# EasyEDA Pro project ProProject_F4_2025-05-21.epro, board PCB1_2
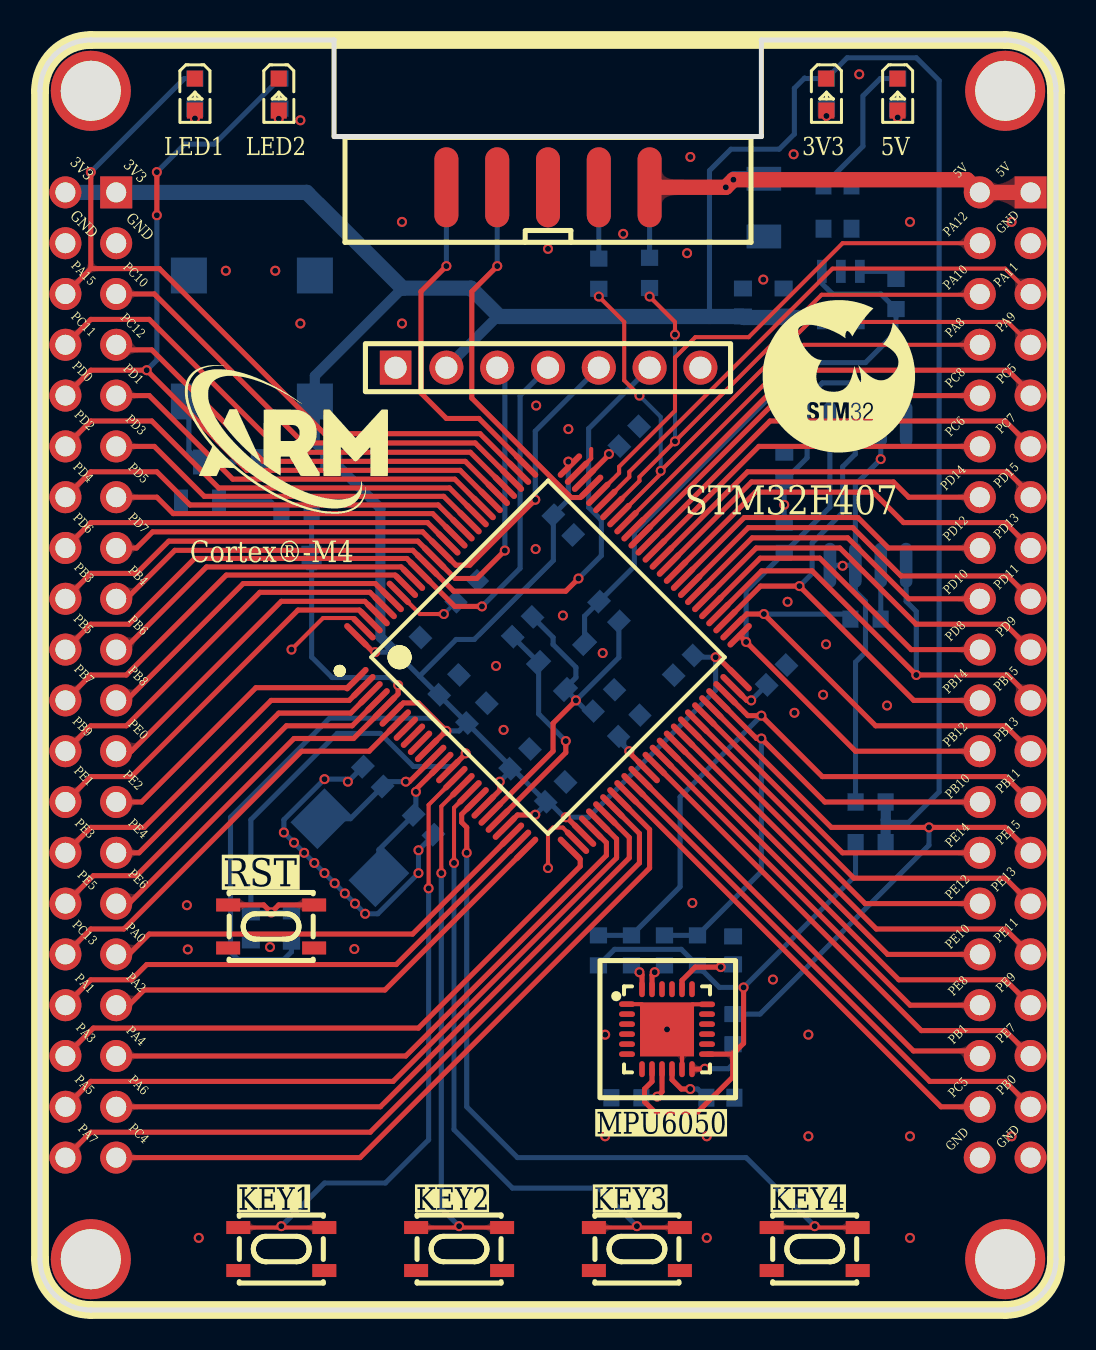
[diagram p8: board, top side]
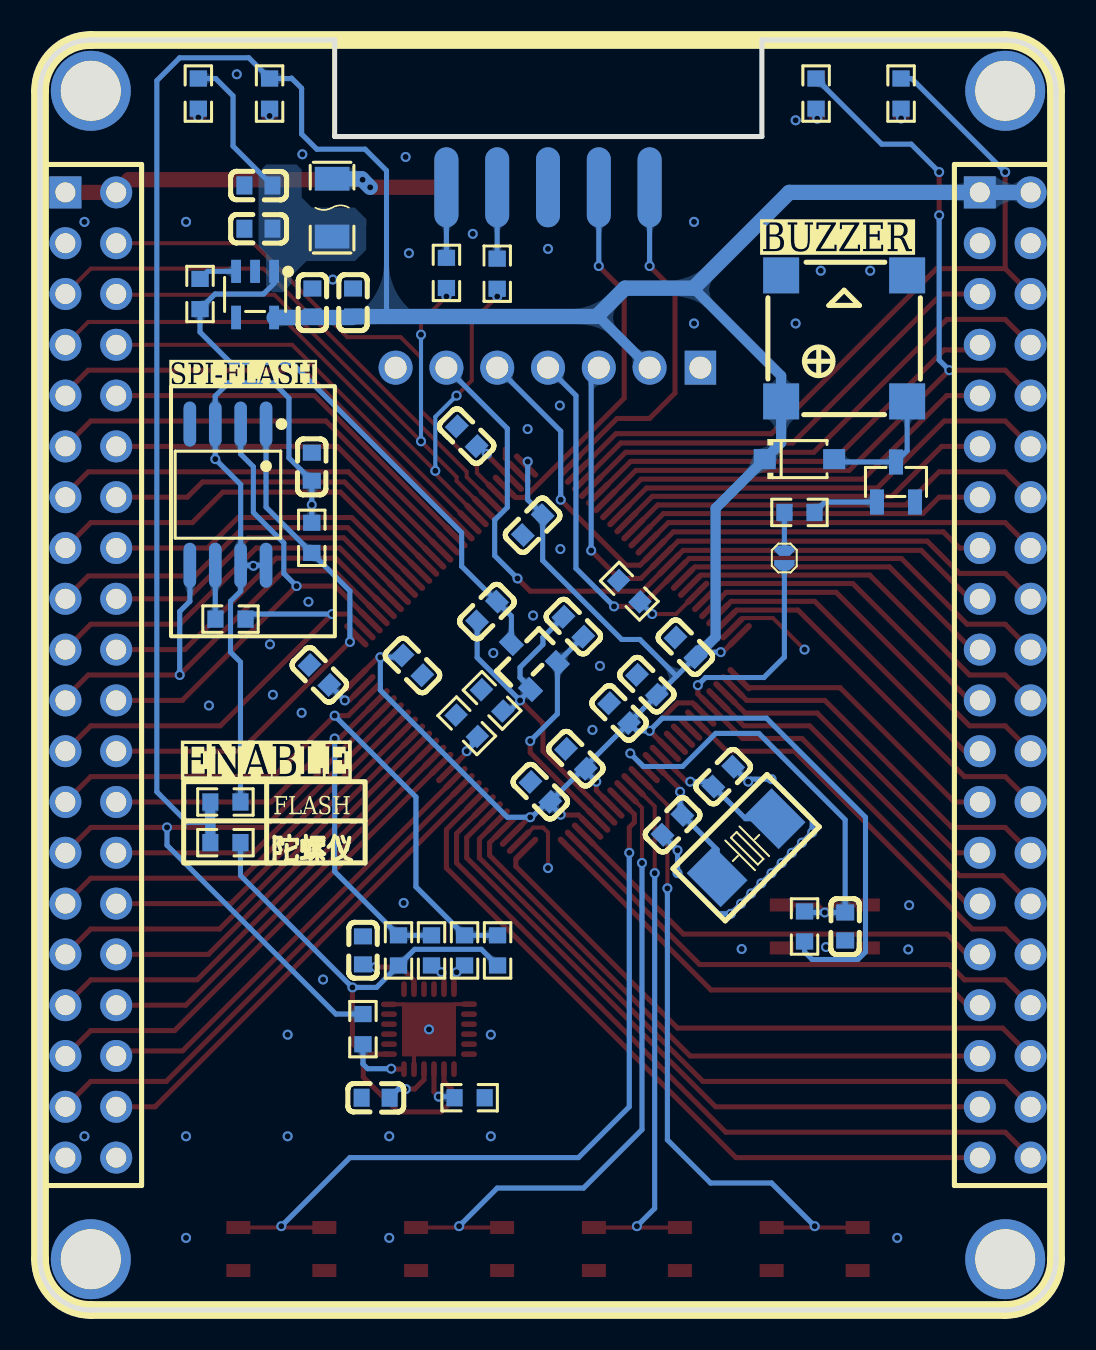
[diagram p9: board, bottom side, seen from below]

Outline 50.8 x 63.5 mm; copper layers: Top Layer, Bottom Layer. Coordinates in mm from the lower left corner of the outline.
Outline path: 0,60.96 0,2.54 arc(0.74,0.74) 2.54,0 48.26,0 arc(50.06,0.74) 50.8,2.54 50.8,60.96 arc(50.06,62.76) 48.26,63.5 36.07,63.5 36.07,58.67 14.7,58.67 14.7,63.5 2.54,63.5 arc(0.74,62.76) 0,60.96
Stack: Top Layer 0.035mm - / Dielectric1 1.51mm FR4 er 4.5 / Bottom Layer 0.035mm -

## Design rules (mm)
net OSC_OUT: DP4
net OSC_IN: DP4
net OSC32_IN: DP3
net OSC32_OUT: DP3
template: 自定义配置
spacing copperThickness1oz (default): track to track 0.102, other pairs 0.152 to 0.3
spacing copperThickness2oz: track to track 0.203, other pairs 0.152 to 0.3
track width copperThickness1oz (default): min 0.127, default 0.254, max 2.54
track width copperThickness2oz: min 0.203, default 0.254, max 2.54
differential pair differentialPair (default): width min 0.127, default 0.254, max 2.54; gap min 0.152, default 0.152
via viaSize (default): diameter min 0.399, default 0.5, max 10; hole min 0.3, default 0.3, max 6.299

## Placement (name value [footprint] x y rotation side)
BUZZER1  SMD-7525  [BUZ-SMD_4P-L7.5-W7.5-BR]  10.59 48.58 270 bottom
C17  100nF  [C0603]  37.21 42.16 90 bottom
C19  1uF  [C0603]  39.88 56.22 0 bottom
C20  10nF  [C0603]  39.88 54.06 0 bottom
C21  1uF  [C0603]  37.18 50.38 90 bottom
C22  10nF  [C0603]  35.15 50.38 90 bottom
D2  1N4148W  [SOD-123F_L2.7-W1.6-LS3.8-RD]  12.83 42.55 180 bottom
H1  -  [HDR-TH_7P-P2.54-V-F]  25.4 47.12 0 top
LED2  -  [LED_0603]  39.32 60.72 270 top
LED5  -  [LED_0603]  42.89 60.72 270 top
LED8  -  [LED_0603]  7.75 60.72 270 top
LED9  -  [LED_0603]  11.94 60.72 270 top
NOREF  -  [Pad_e925]  48.26 2.54 0 top
NOREF#2  -  [Pad_e924]  2.54 2.54 0 top
NOREF#3  -  [Pad_e923]  2.54 60.96 0 top
NOREF#4  -  [Pad_e112]  48.26 60.96 0 top
P1  2.54-2*5P简牛  [简牛2*5-2.54]  25.4 56.13 0 top
Q3  SS8050  [SOT-23-3_L2.9-W1.3-P1.90-LS2.4-BR]  8 41.4 270 bottom
R3  10kΩ  [R0603]  12.57 19.18 270 bottom
R4  20Ω  [R0603]  27.94 51.82 90 bottom
R5  20Ω  [R0603]  30.48 51.85 90 bottom
R8  180  [R0603]  12.83 39.88 180 bottom
R12  10K  [R0603]  42.8 50.8 270 bottom
R16  10K  [R0603]  21.34 35.94 45 bottom
R17  0  [R0603]  28.19 30.48 45 bottom
R22  10K  [R0603]  29.46 29.21 45 bottom
R27  10K  [R0603]  27.92 17.98 270 bottom
R28  10K  [R0603]  32.88 17.98 270 bottom
R29  120R  [R0603]  29.57 17.98 90 bottom
R30  120R  [R0603]  31.22 17.98 90 bottom
R31  120R  [R0603]  34.65 14.04 270 bottom
R32  10K  [R0603]  29.32 10.61 0 bottom
R44  22  [R0603]  41.28 34.54 0 bottom
R45  10K  [R0603]  37.21 38.61 90 bottom
R47  10kΩ  [R0603]  39.32 60.82 90 bottom
R50  10kΩ  [R0603]  42.88 60.82 90 bottom
R53  10kΩ  [R0603]  7.75 60.82 90 bottom
R54  10kΩ  [R0603]  12 60.82 90 bottom
R56  0  [R0603]  41.53 23.37 0 bottom
R57  0  [R0603]  41.53 25.4 0 bottom
RST  YTS-A016-2  [SW-SMD_4P-L4.2-W3.3-P2.15-LS4.7]  11.56 19.18 0 top
SW3  YTS-A016-2  [SW-SMD_4P-L4.2-W3.3-P2.15-LS4.7]  12.06 3.05 0 top
SW4  YTS-A016-2  [SW-SMD_4P-L4.2-W3.3-P2.15-LS4.7]  20.96 3.05 0 top
SW5  YTS-A016-2  [SW-SMD_4P-L4.2-W3.3-P2.15-LS4.7]  29.84 3.05 180 top
SW6  YTS-A016-2  [SW-SMD_4P-L4.2-W3.3-P2.15-LS4.7]  38.74 3.05 180 top
U1  STM32F407VET6  [LQFP-100_L14.0-W14.0-P0.50-LS16.0-BL]  25.4 32.64 315 top
U2  18pF  [C0603]  16.64 26.67 135 bottom
U3  18pF  [C0603]  19.18 24.26 315 bottom
U4  PJ75AL33SA  [SOT-23_L2.9-W1.3-P1.90-LS2.4-BR]  26.42 32.51 225 bottom
U5  100nF  [C0603]  24.13 34.16 225 bottom
U6  1uF  [C0603]  28.45 34.92 135 bottom
U7  1uF  [C0603]  36.83 31.75 225 bottom
U8  1uF  [C0603]  29.46 43.69 225 bottom
U9  100nF  [C0603]  10.54 19.18 90 bottom
U16  100nF  [C0603]  24 27.56 225 bottom
U17  100nF  [C0603]  21.84 29.84 225 bottom
U18  100nF  [C0603]  20.45 31.26 225 bottom
U19  100nF  [C0603]  18.53 33.13 225 bottom
U20  100nF  [C0603]  26.16 39.24 135 bottom
U29  100nF  [C0603]  25.78 25.91 225 bottom
U30  100nF  [C0603]  32.18 32.23 45 bottom
U31  1.5A快恢复保险丝-1206  [F1206]  36.19 55.12 270 bottom
U32  MPU-6050  [QFN-24_L4.0-W4.0-P0.50-BL-EP2.7]  31.35 14.04 270 top
U33  100nF  [C0603]  34.02 10.61 0 bottom
U34  100nF  [C0603]  34.65 17.98 270 bottom
U36  -  [短接焊盘]  13.59 37.59 90 bottom
U37  W25Q128JVSIQ  [SOIC-8_L5.3-W5.3-P1.27-LS8.0-BL]  41.4 40.77 0 bottom
U38  2.54-2*20  [HDR-TH_40P-P2.54-V-F-R2-C20-S2.54]  48.26 31.75 270 bottom
U39  2.54-2*20  [HDR-TH_40P-P2.54-V-F-R2-C20-S2.54]  2.54 31.75 270 bottom
U40  RT9013-33GB  [SOT-23-5_L3.0-W1.7-P0.95-LS2.8-BL]  40.05 50.78 0 bottom
X1  8MHz  [OSC-SMD_L5.0-W3.2]  15.49 23.11 135 bottom

## Footprints (pads in the part's own frame, mm; a bottom-side part is the same pattern mirrored in y, then rotated)
BUZ-SMD_4P-L7.5-W7.5-BR
  rect 1.8x1.8 smd: 1(3.15,-3.15) 2(3.15,3.15) 3(-3.15,3.15) 4(-3.15,-3.15)
C0603
  rect 0.8x0.9 smd: 1(-0.7,0) 2(0.7,0)
F1206
  rect 1.19x1.728 smd: 1(-1.445,0) 2(1.445,0)
HDR-TH_7P-P2.54-V-F
  rect 1.575x1.7 hole 1.1: 1(-7.62,0)
  round 1.7 hole 1.1: 2(-5.08,0) 3(-2.54,0) 4(0,0) 5(2.54,0) 6(5.08,0) 7(7.62,0)
HDR-TH_40P-P2.54-V-F-R2-C20-S2.54
  rect 1.6x1.6 hole 1: 1(-24.13,-1.27)
  round 1.6 hole 1: 2(-24.13,1.27) 3(-21.59,-1.27) 4(-21.59,1.27) 5(-19.05,-1.27) 6(-19.05,1.27) 7(-16.51,-1.27) 8(-16.51,1.27) 9(-13.97,-1.27) 10(-13.97,1.27) 11(-11.43,-1.27) 12(-11.43,1.27) 13(-8.89,-1.27) 14(-8.89,1.27) 15(-6.35,-1.27) 16(-6.35,1.27) 17(-3.81,-1.27) 18(-3.81,1.27) 19(-1.27,-1.27) 20(-1.27,1.27) 21(1.27,-1.27) 22(1.27,1.27) 23(3.81,-1.27) 24(3.81,1.27) 25(6.35,-1.27) 26(6.35,1.27) 27(8.89,-1.27) 28(8.89,1.27) 29(11.43,-1.27) 30(11.43,1.27) 31(13.97,-1.27) 32(13.97,1.27) 33(16.51,-1.27) 34(16.51,1.27) 35(19.05,-1.27) 36(19.05,1.27) 37(21.59,-1.27) 38(21.59,1.27) 39(24.13,-1.27) 40(24.13,1.27)
LED_0603
  rect 0.8x0.8 smd: 1(-0.851,-0.01) 2(0.75,-0.005)
LQFP-100_L14.0-W14.0-P0.50-LS16.0-BL
  oval 0.3x1.6 smd: 1(-6,-7.55) 2(-5.5,-7.55) 3(-5,-7.55) 4(-4.5,-7.55) 5(-4,-7.55) 6(-3.5,-7.55) 7(-3,-7.55) 8(-2.5,-7.55) 9(-2,-7.55) 10(-1.5,-7.55) 11(-1,-7.55) 12(-0.5,-7.55) 13(0,-7.55) 14(0.5,-7.55) 15(1,-7.55) 16(1.5,-7.55) 17(2,-7.55) 18(2.5,-7.55) 19(3,-7.55) 20(3.5,-7.55) 21(4,-7.55) 22(4.5,-7.55) 23(5,-7.55) 24(5.5,-7.55) 25(6,-7.55) 51(6,7.55) 52(5.5,7.55) 53(5,7.55) 54(4.5,7.55) 55(4,7.55) 56(3.5,7.55) 57(3,7.55) 58(2.5,7.55) 59(2,7.55) 60(1.5,7.55) 61(1,7.55) 62(0.5,7.55) 63(0,7.55) 64(-0.5,7.55) 65(-1,7.55) 66(-1.5,7.55) 67(-2,7.55) 68(-2.5,7.55) 69(-3,7.55) 70(-3.5,7.55) 71(-4,7.55) 72(-4.5,7.55) 73(-5,7.55) 74(-5.5,7.55) 75(-6,7.55)
  oval 1.6x0.3 smd: 26(7.55,-6) 27(7.55,-5.5) 28(7.55,-5) 29(7.55,-4.5) 30(7.55,-4) 31(7.55,-3.5) 32(7.55,-3) 33(7.55,-2.5) 34(7.55,-2) 35(7.55,-1.5) 36(7.55,-1) 37(7.55,-0.5) 38(7.55,0) 39(7.55,0.5) 40(7.55,1) 41(7.55,1.5) 42(7.55,2) 43(7.55,2.5) 44(7.55,3) 45(7.55,3.5) 46(7.55,4) 47(7.55,4.5) 48(7.55,5) 49(7.55,5.5) 50(7.55,6) 76(-7.55,6) 77(-7.55,5.5) 78(-7.55,5) 79(-7.55,4.5) 80(-7.55,4) 81(-7.55,3.5) 82(-7.55,3) 83(-7.55,2.5) 84(-7.55,2) 85(-7.55,1.5) 86(-7.55,1) 87(-7.55,0.5) 88(-7.55,0) 89(-7.55,-0.5) 90(-7.55,-1) 91(-7.55,-1.5) 92(-7.55,-2) 93(-7.55,-2.5) 94(-7.55,-3) 95(-7.55,-3.5) 96(-7.55,-4) 97(-7.55,-4.5) 98(-7.55,-5) 99(-7.55,-5.5) 100(-7.55,-6)
OSC-SMD_L5.0-W3.2
  rect 1.9x2.4 smd: 1(-2.05,0) 2(2.05,0)
Pad_e112
  round 4 hole 3: 0(0,0)
Pad_e923
  round 4 hole 3: 0(0,0)
Pad_e924
  round 4 hole 3: 0(0,0)
Pad_e925
  round 4 hole 3: 0(0,0)
QFN-24_L4.0-W4.0-P0.50-BL-EP2.7
  oval 0.28x0.8 smd: 1(-1.25,-2) 2(-0.75,-2) 3(-0.25,-2) 4(0.25,-2) 5(0.75,-2) 6(1.25,-2) 13(1.25,2) 14(0.75,2) 15(0.25,2) 16(-0.25,2) 17(-0.75,2) 18(-1.242,2)
  oval 0.8x0.28 smd: 7(2,-1.25) 8(2,-0.75) 9(2,-0.25) 10(2,0.25) 11(2,0.75) 12(2,1.25) 19(-2,1.25) 20(-2,0.75) 21(-2,0.25) 22(-2,-0.25) 23(-2,-0.75) 24(-2,-1.25)
  rect 2.7x2.7 smd: 25(0.013,0)
R0603
  rect 0.806x0.864 smd: 1(-0.753,0) 2(0.753,0)
SOD-123F_L2.7-W1.6-LS3.8-RD
  rect 1.1x1 smd: 1(-1.735,0) 2(1.735,0)
SOIC-8_L5.3-W5.3-P1.27-LS8.0-BL
  oval 0.63x2.25 smd: 1(-1.905,-3.53) 2(-0.635,-3.53) 3(0.635,-3.53) 4(1.905,-3.53) 5(1.905,3.53) 6(0.635,3.53) 7(-0.635,3.53) 8(-1.905,3.53)
SOT-23-3_L2.9-W1.3-P1.90-LS2.4-BR
  rect 1.25x0.7 smd: 1(1,-0.95) 2(1,0.95) 3(-1,0)
SOT-23-5_L3.0-W1.7-P0.95-LS2.8-BL
  rect 0.49x1.157 smd: 1(-0.95,-1.153) 2(0,-1.153) 3(0.95,-1.153)
  rect 0.49x1.175 smd: 4(0.95,1.153) 5(-0.95,1.153)
SOT-23_L2.9-W1.3-P1.90-LS2.4-BR
  rect 1x0.8 smd: 1(1.15,-0.95) 2(1.15,0.95) 3(-1.15,0)
SW-SMD_4P-L4.2-W3.3-P2.15-LS4.7
  rect 1.2x0.65 smd: 1(-2.15,1.075) 2(2.15,1.075) 3(-2.15,-1.075) 4(2.15,-1.075)
短接焊盘
  custom 0.508x1.016 smd: 1(-0.353,-0.008) 2(0.368,-0.015)
简牛2*5-2.54
  oval 1.2x4 smd: 1(-5.08,0) 3(-2.54,0) 5(0,0) 7(2.54,0) 9(5.08,0)
  oval 1.2x4 smd far side: 2(-5.08,0) 4(-2.54,0) 6(0,0) 8(2.54,0) 10(5.08,0)

## Nets
As in the schematic.

Pads without a net: BUZZER1 3 4; H1 7; NOREF 0; NOREF#2 0; NOREF#3 0; NOREF#4 0; P1 1 3 7; U32 2 3 4 5 6 7 14 15 16 17 19 21 22; U40 4

## Via types
v1: diameter 0.503, hole 0.299, Top Layer to Bottom Layer, 19 vias
v2: diameter 0.5, hole 0.3, Top Layer to Bottom Layer, 105 vias

## Routing (per net, layer and track width the routed paths; a pad name or vN(x,y) marks a point on that pad's centre or on a via; arc(x,y) is an arc through that point)
3V3: length 209.6
  Top Layer w0.254: U1.19 22.99,25.98 v2(22.99,26.42) ; 15.82,33.73 16.66,32.89 v2(16.76,32.89) ; U1.11 20.3,28.96 v2(20.32,28.96) 18.92,30.35 18.16,30.35 U1.6 ; v2(33.78,32.64) 33.89,32.64 34.98,31.54 ; U1.22 23.88,24.75 24.75,24.75 v2(24.77,24.77) ; U1.28 26.33,24.64 v2(26.29,24.64)
  Bottom Layer w0.254: 18.03,32.64 18.97,31.7 ; 18.97,31.7 20.81,33.53 21.72,33.53 25.67,37.48 U20.2 ; 18.97,31.7 19.91,30.76 U18.2 19.96,30.74 21.35,29.35 ; 25.35,25.35 25.41,25.29 ; 25.35,25.35 23.64,27.06 ; 25.35,25.35 v2(24.77,24.77) ; 25.35,25.35 25.43,25.42 26.21,24.64 v2(26.29,24.64) 27.43,24.64 33.78,30.99 v2(33.78,32.64) 32.76,32.64 U30.2 ; 23.64,27.06 21.35,29.35 ; 23.64,27.06 v2(22.99,26.42) ; 23.64,27.06 U16.2 23.64,27.06 ; 21.35,29.35 20.96,28.96 v2(20.32,28.96) 19.69,29.59 14.48,29.59 9.53,24.64 9.53,17.91 9.91,17.53 12.19,17.53 12.57,17.91 R3.2 ; 25.54,39.64 26.42,40.51 v2(26.42,42.42) ; 17.78,32.89 v2(16.76,32.89) ; 33.47,49.68 33.47,56.97 34.54,58.04 36.96,58.04 37.72,58.8 37.72,61.09 38.23,61.59 38.25,61.57 R47.2 40.36,62.61 43.81,62.61 44.96,61.47 44.96,25.91 43.43,24.38 42.42,24.38 42.29,24.51
  Bottom Layer w0.508: 17.78,32.89 17.02,33.65 17.02,40.09 D2.1 13.74,43.36 BUZZER1.1 13.74,46.71 18.12,51.09 ; R57.2 42.29,25.39 42.29,24.51 42.28,24.5 R56.2 ; 22.97,49.68 22.88,49.68 H1.2
  Bottom Layer w0.762: U39.2 U39.1 13.34,55.88 18.12,51.09 21.55,51.09 22.97,49.68 C22.1 35.2,49.62 U40.5 ; 17.78,32.89 18.03,32.64
5V: length 37.2
  Bottom Layer w0.254: C19.1 41.15,58.19 41.15,60.71 42.02,61.57 R50.2 ; U40.1 39.09,51.33 39.62,50.8 42.05,50.8 R12.2 42.8,48.89 41.28,47.37 38.22,47.37 29.72,38.87 29.72,37.19 27.23,34.7 27.23,33.33
AGND: length 18.9
  Top Layer w0.254: v2(26.8,30.48) 25.65,29.34 25.65,27.94 U1.20
  Bottom Layer w0.254: R17.1 27.33,29.95 v2(26.8,30.48) ; U5.1 25.65,33.63 25.65,33.27 26.8,32.13 26.8,31.62 26.27,31.1 U4.1 26.8,30.5 v2(26.8,30.48) ; v2(26.8,30.48) 28.94,32.63 28.94,34.43
GND: length 30.6
  Top Layer w0.203: U32.11 32.1,13.28 v2(31.35,14.03) ; U32.1 30.09,15.29 ; 27.56,43.05 27.56,42.58 26.85,41.87 ; v2(25.4,22.1) 25.4,23.88 25.65,24.12 26.14,24.12 U1.27 ; U1.99 15.66,34.6 14.15,34.6 v2(12.57,33.02) ; U32.18 32.61,15.28
  Bottom Layer w0.254: U3.2 19.67,23.74 v2(18.92,22.99) v2(18.92,21.84) 16.89,19.81 v2(16.26,19.81) v2(15.75,20.32) v2(15.24,20.83) v2(14.73,21.34) v2(14.22,21.84) v2(13.72,22.35) v2(13.21,22.86) v2(12.7,23.37) v2(12.19,23.88) 12.19,24.51 v2(14.22,26.54) 15.27,26.54 v2(15.39,26.42) U2.2
  vias: v1(7.94,3.61) v1(9.29,51.96) v1(11.76,51.96) v1(13.02,59.49) v1(13.02,49.33) v1(18.1,54.41) v1(18.1,49.33) v1(23.18,29.01) v1(28.26,13.77) v1(28.26,8.69) v1(33.34,8.69) v1(33.34,3.61) v1(38.42,13.77) v1(38.42,8.69) v1(43.5,54.41) v1(43.5,8.69) v1(43.5,3.61) v1(48.58,54.41) v1(48.58,8.69) v2(7.34,20.24) v2(7.39,18.03) v2(11.5,18.15) v2(15.72,18.05) v2(22.8,32.2) v2(24.81,45.22) v2(24.78,38.05) v2(25.4,53.06) v2(26.15,34.72) v2(26.42,44.05) v2(28.14,32.85) v2(29.16,53.81) v2(32.35,52.84) v2(32.52,57.65) v2(32.62,20.35) v2(36.16,51.52) v2(36.65,16.52) v2(37.38,35.41) v2(37.68,57.78) v2(37.72,29.86) v2(39.16,30.76) v2(39.3,33.28) v2(40.96,61.79) v2(42.35,30.22)
VIN: length 21.6
  Top Layer w0.762: U38.1 U38.2 46.36,56.52 v2(34.67,56.52) v2(34.29,56.13) P1.9
  Bottom Layer w0.762: v2(34.29,56.13) 34.72,56.56 36.19,56.56
BOOT0: length 3.6
  Top Layer w0.203: U1.94 19,34.8 v2(20.19,34.8)
  Bottom Layer w0.203: R16.1 v2(20.19,34.8)
BOOT1: length 2.3
  Top Layer w0.254: v2(29.46,27.94) 29.46,27.87 30.39,26.95
  Bottom Layer w0.254: v2(29.46,27.94) 29.19,28.22 29.19,28.42 R22.1
BUZZER: length 1.9
  Bottom Layer w0.254: U36.2 13.58,37.97 R8.1
FLASH_VCC: length 33.5
  Bottom Layer w0.254: U37.7 40.77,35.94 41.28,35.43 41.28,32.89 40.78,32.39 R57.1 ; U37.7 40.77,41.28 v2(42.04,42.55) U37.3 42.04,45.7 41.38,46.36 39.12,46.36 38.35,45.59 38.35,42.61 C17.1 v2(37.21,40.26) R45.2 ; U37.7 U37.8
  vias: v2(40.13,37.21)
KEY1: length 32.1
  Top Layer w0.203: v2(19.43,21.08) 19.43,25.26 U1.15 ; SW3.1 SW3.2
  Bottom Layer w0.254: v2(19.43,21.08) 19.43,8.51 17.27,6.35 14.22,6.35 v2(12.06,4.19)
KEY2: length 27.2
  Top Layer w0.203: SW4.1 SW4.2 ; U1.16 20.07,25.18 v2(20.07,21.84)
  Bottom Layer w0.254: v2(20.07,21.84) 20.07,5.08 v2(20.96,4.19)
KEY3: length 32.6
  Top Layer w0.203: U1.17 20.7,25.11 v2(20.7,22.35) ; SW5.4 31.99,4.12
  Bottom Layer w0.254: v2(20.7,22.35) 20.7,9.02 23.62,6.1 27.94,6.1 v2(29.84,4.19)
KEY4: length 40
  Top Layer w0.203: SW6.4 SW6.3
  Top Layer w0.254: v2(21.34,22.86) 21.34,24.13 21.08,24.38 21.08,24.79 U1.18
  Bottom Layer w0.254: v2(21.34,22.86) 21.34,10.16 23.88,7.62 35.31,7.62 v2(38.74,4.19)
LCD_DC: length 37.8
  Top Layer w0.254: v2(26.92,36.58) 26.29,35.94 20.68,35.94 U1.90 18.64,37.98 6.74,37.98 4.32,35.56 U39.17
  Bottom Layer w0.254: v2(26.92,36.58) 28.07,37.72 28.07,39.5 27.43,40.13 27.43,44.07 H1.6
LCD_RES: length 31.3
  Top Layer w0.254: v2(24.77,40.51) 21.49,37.24 20.8,37.24 U1.88 19.13,38.91 5.63,38.91 4.83,38.1 U39.15
  Bottom Layer w0.254: H1.5 24.77,43.94 v2(24.77,40.51)
LCD_SCL: length 33.8
  Top Layer w0.254: v2(23.24,37.97) 21.84,36.58 20.76,36.58 U1.89 18.89,38.44 6.44,38.44 4.83,36.83 2.54,36.83 U39.18
  Bottom Layer w0.254: v2(23.24,37.97) 23.24,46.74 H1.3
LCD_SDA: length 37
  Top Layer w0.254: U39.20 2.54,34.29 4.44,34.29 7.73,37.58 18.34,37.58 U1.91 20.74,35.18 v2(22.1,35.18)
  Bottom Layer w0.254: v2(22.1,35.18) 24,37.08 24,45.72 H1.4
LED1: length 42.7
  Top Layer w0.254: U39.10 2.54,46.99 v2(5.33,46.99) 10.34,41.98 21.01,41.98 U1.81 ; v2(5.84,56.9) v2(5.84,54.74)
  Bottom Layer w0.254: v2(5.84,54.74) 5.84,47.5 v2(5.33,46.99) ; v2(5.84,56.9) 7.24,58.29 8.71,58.29 R54.2
LED2: length 39.4
  Top Layer w0.254: v2(2.54,56.9) 2.54,52.07 ; 2.54,52.07 5.97,52.07 14.22,43.81 22,43.81 23.95,41.87 ; 2.54,52.07 U39.6
  Bottom Layer w0.254: R53.2 7.22,61.57 v2(2.54,56.9)
MPU_INT: length 33.2
  Top Layer w0.254: U38.27 48.26,24.13 v2(44.45,24.13) 39.57,24.13 U1.46
  Bottom Layer w0.254: v2(44.45,24.13) 44.45,23.24 36,14.8 R31.1
MPU_SCL: length 28
  Top Layer w0.254: U38.26 39.24,25.4 v2(36.07,28.58) 35.83,28.58 U1.47
  Bottom Layer w0.254: R30.2 R28.1 36.07,21.93 v2(36.07,28.58)
MPU_SDA: length 32.8
  Top Layer w0.254: U1.48 35.39,29.72 v2(36.07,29.72) 39.12,26.67 48.26,26.67 U38.25
  Bottom Layer w0.254: R27.1 R29.2 32,21.16 32,25.65 v2(36.07,29.72)
MPU_VCC: length 31.1
  Top Layer w0.254: 34.64,12.79 35.18,13.33 v2(35.18,16.13) ; 34.64,12.79 U32.13 ; 34.64,12.79 34.64,11.65 32.89,9.91 30.73,9.91 30.23,10.41 30.23,11.05 30.6,11.42 U32.8
  Bottom Layer w0.254: R27.2 28.73,18.03 32.07,18.03 R28.2 33.97,16.13 v2(35.18,16.13) 40.78,21.73 R56.1
NRST: length 26
  Top Layer w0.254: RST.2 11.94,20.25 v2(11.56,19.88) 11.19,20.25 RST.1 ; v2(21.29,27.83) 21.29,27.82 20.41,26.95
  Bottom Layer w0.254: R3.1 12.52,19.88 v2(11.56,19.88) 10.54,19.88 10.54,24.51 14.86,28.83 17.02,28.83 18.67,27.18 20.63,27.18 v2(21.29,27.83)
OSC_IN: length 6.9
  Top Layer w0.254: v2(18.29,26.42) 18.47,26.42 U1.12
  Bottom Layer w0.254: X1.2 15.52,24.56 U2.1 17.37,26.42 v2(18.29,26.42)
OSC_OUT: length 6.9
  Top Layer w0.254: U1.13 18.8,26.03 v2(18.8,25.91)
  Bottom Layer w0.254: v2(18.8,25.91) 18.8,24.87 U3.1 16.94,23.01 X1.1
PA0: length 22.3
  Top Layer w0.254: U1.23 18.63,18.8 5.46,18.8 4.44,17.78 U39.31
PA1: length 26.1
  Top Layer w0.254: U1.24 17.81,17.27 5.33,17.27 4.57,16.51 2.54,16.51 U39.34
PA2: length 23.7
  Top Layer w0.254: U1.25 17.25,16 5.21,16 4.44,15.24 U39.33
PA3: length 30.8
  Top Layer w0.254: U39.36 2.67,14.1 18.92,14.1 27.01,22.18 27.01,22.54 U1.26
PA4: length 30.4
  Top Layer w0.254: U39.35 18.29,12.7 28.32,22.73 28.32,23.37 27.57,24.12 U1.29
PA5: length 35
  Top Layer w0.254: U39.38 2.54,11.43 17.65,11.43 28.83,22.61 28.83,23.55 U1.30
PA6: length 33.5
  Top Layer w0.254: U39.37 17.02,10.16 29.46,22.61 29.46,23.62 U1.31
PA7: length 38.2
  Top Layer w0.254: U39.40 2.54,8.89 16.51,8.89 29.97,22.35 29.97,23.82 U1.32
PA8: length 21.3
  Top Layer w0.203: U1.67 38.19,48.26 U38.8
PA9: length 35.1
  Top Layer w0.203: U1.68 31.03,41.81 v2(31.03,41.96) 38.48,49.4 48.39,49.4 U38.7 ; v2(27.94,50.67) 29.21,49.4 29.21,46.48 v2(29.97,45.72)
  Bottom Layer w0.203: v2(31.03,41.96) 31.03,44.66 v2(29.97,45.72)
PA10: length 30.7
  Top Layer w0.203: v2(31.75,48.77) 31.75,49.4 v2(30.48,50.67) ; U38.6 46.99,50.76 39.08,50.76 v2(31.75,43.43) 29.97,41.66 29.97,41.45 28.62,40.1
  Bottom Layer w0.203: v2(31.75,43.43) v2(31.75,48.77)
PA11: length 26.8
  Top Layer w0.203: U38.5 48.26,52.07 39.62,52.07 29.46,41.91 29.46,41.65 U1.70
PA12: length 26
  Top Layer w0.203: U1.71 28.96,41.85 28.96,42.16 31.75,44.96 31.75,47.62 32.77,48.64 35.43,48.64 40.13,53.34 U38.4
PA13: length 19.3
  Top Layer w0.254: U1.72 27.02,40.62 26.56,40.62 21.59,45.59 21.59,50.92 v2(22.86,52.2)
  Bottom Layer w0.254: P1.4 22.86,52.2
PA14: length 17.6
  Top Layer w0.254: U1.76 21.95,44.58 20.32,44.58 19.05,45.85 19.05,50.93 v2(20.32,52.2)
  Bottom Layer w0.254: P1.2 v2(20.32,52.2)
PB0: length 26.5
  Top Layer w0.254: U38.37 48.26,11.43 44.49,11.43 U1.35
PB1: length 22.7
  Top Layer w0.254: U1.36 43.67,12.95 46.74,12.95 U38.36
PB6: length 16.8
  Top Layer w0.254: U1.92 18.06,37.15 8.33,37.15 4.19,33.02 U39.19
PB7: length 19.8
  Top Layer w0.254: U39.22 2.54,31.75 4.32,31.75 9.31,36.75 17.76,36.75 U1.93
PB8: length 16.5
  Top Layer w0.254: U39.21 4.32,30.48 10.16,36.32 16.77,36.32 U1.95
PB9: length 19.6
  Top Layer w0.254: 17.23,35.15 16.5,35.88 10.99,35.88 4.32,29.21 2.54,29.21 U39.24
PB12: length 27
  Top Layer w0.254: U38.24 40.78,27.94 34.98,33.73
  Bottom Layer w0.254: U37.1 39.5,40.14 R45.1 35.31,35.95 v2(35.31,33.4)
PB13: length 22.5
  Top Layer w0.254: U1.52 35.34,34.8 v2(36.19,34.8) 41.78,29.21 48.26,29.21 U38.23
  Bottom Layer w0.254: v2(36.19,34.8) 40.27,34.8 R44.1
PB14: length 25.1
  Top Layer w0.254: U1.53 36.03,36.19 v2(37.97,36.19) 43.69,30.48 U38.22
  Bottom Layer w0.254: v2(37.97,36.19) 38.61,36.83 38.61,38.35 40.13,39.88 40.13,42.16 40.77,42.8 U37.2
PB15: length 25
  Top Layer w0.254: U1.54 36.08,36.96 38.61,36.96 v2(43.81,31.75) 48.39,31.75 49.53,30.61 U38.21
  Bottom Layer w0.254: v2(43.81,31.75) 43.81,34.92 43.31,35.43 U37.5
PC4: length 36.7
  Top Layer w0.254: U1.33 30.48,24.02 30.48,22.1 16,7.62 U39.39
PC5: length 24.2
  Top Layer w0.254: U1.34 45.05,10.16 U38.38
PC6: length 18.4
  Top Layer w0.254: U1.63 35.94,43.18 U38.12
PC7: length 22.2
  Top Layer w0.254: U38.11 48.26,44.45 36.5,44.45 30.39,38.33
PC8: length 19.9
  Top Layer w0.254: U1.65 37.07,45.72 U38.10
PC9: length 23.7
  Top Layer w0.254: U1.66 37.63,46.99 48.39,46.99 49.53,45.85 U38.9
PC10: length 23.6
  Top Layer w0.254: 23.6,41.51 21.76,43.35 13.16,43.35 5.72,50.8 U39.5
PC11: length 26
  Top Layer w0.254: U39.8 2.54,49.53 5.46,49.53 12.1,42.89 21.52,42.89 U1.79
PC12: length 22.2
  Top Layer w0.254: U39.7 4.06,48.01 5.59,48.01 11.16,42.43 21.26,42.43 U1.80
PC13: length 21.5
  Top Layer w0.254: U39.32 2.54,19.05 4.19,19.05 13.08,27.94 16.46,27.94 U1.7
PD1: length 20.7
  Top Layer w0.254: U39.9 5.46,45.72 9.64,41.54 20.74,41.54 22.18,40.1
PD2: length 23
  Top Layer w0.254: U1.83 20.47,41.1 8.94,41.1 5.59,44.45 2.54,44.45 U39.12
PD3: length 19.2
  Top Layer w0.254: U39.11 5.72,43.18 8.21,40.68 20.18,40.68 U1.84
PD4: length 21.6
  Top Layer w0.254: U39.14 2.54,41.91 5.84,41.91 7.5,40.25 19.91,40.25 U1.85
PD5: length 17.8
  Top Layer w0.254: U39.13 5.84,40.64 6.66,39.82 19.63,39.82 U1.86
PD6: length 20.1
  Top Layer w0.254: 20.41,38.33 19.38,39.37 2.54,39.37 U39.16
PD8: length 16.3
  Top Layer w0.254: U38.20 43.56,33.02 38.99,37.59 36.01,37.59 33.57,35.15
PD9: length 19.5
  Top Layer w0.254: U38.19 48.26,34.29 43.8,34.29 39.99,38.1 35.81,38.1 U1.56
PD10: length 16.5
  Top Layer w0.254: U1.57 35.61,38.61 40.39,38.61 43.43,35.56 U38.18
PD11: length 19.7
  Top Layer w0.254: U38.17 48.39,36.7 43.05,36.7 40.64,39.12 35.41,39.12 U1.58
PD12: length 16.7
  Top Layer w0.254: U1.59 35.21,39.62 40.89,39.62 42.42,38.1 U38.16
PD13: length 20.5
  Top Layer w0.254: U38.15 48.26,39.37 43.18,39.37 41.66,40.89 35.78,40.89 U1.60
PD14: length 17.6
  Top Layer w0.254: U1.61 35.58,41.4 42.67,41.4 43.43,40.64 U38.14
PD15: length 20.8
  Top Layer w0.254: U1.62 35.38,41.91 48.39,41.91 49.53,40.77 U38.13
PE0: length 16.4
  Top Layer w0.254: U1.97 16.24,35.43 12.06,35.43 4.57,27.94 U39.23
PE1: length 19.5
  Top Layer w0.254: U39.26 2.54,26.67 4.57,26.67 12.9,35 15.97,35 U1.98
PE2: length 14.6
  Top Layer w0.254: 15.82,31.54 15.39,31.11 10.8,31.11 5.08,25.4 U39.25
PE3: length 18.4
  Top Layer w0.254: U39.28 2.54,24.13 5.21,24.13 11.56,30.48 15.46,30.48 U1.2
PE4: length 16
  Top Layer w0.254: U1.3 15.53,29.84 11.94,29.84 4.95,22.86 U39.27
PE5: length 19.8
  Top Layer w0.254: U39.30 2.67,21.72 4.83,21.72 12.32,29.21 15.61,29.21 U1.4
PE6: length 28.4
  Top Layer w0.254: U39.29 4.44,20.32 12.7,28.58 15.68,28.58 U1.5 17.91,30.8 v2(17.91,31.24)
  Bottom Layer w0.254: U36.1 13.58,32.65 14.61,31.62 17.53,31.62 v2(17.91,31.24)
PE7: length 24.8
  Top Layer w0.254: U1.38 44.07,13.97 48.26,13.97 U38.35
PE8: length 21
  Top Layer w0.254: U1.39 43.51,15.24 U38.34
PE9: length 23.4
  Top Layer w0.254: U38.33 48.26,16.51 42.94,16.51 U1.40
PE10: length 19.6
  Top Layer w0.254: 31.8,28.36 42.38,17.78 U38.32
PE11: length 21.9
  Top Layer w0.254: U1.42 41.82,19.05 48.26,19.05 U38.31
PE12: length 18.1
  Top Layer w0.254: U1.43 41.25,20.32 U38.30
PE13: length 20.4
  Top Layer w0.254: U38.29 48.26,21.59 40.69,21.59 U1.44
PE14: length 16.6
  Top Layer w0.254: U38.28 40.13,22.86 U1.45
$1N1608: length 11.7
  Top Layer w0.254: U1.21 26.29,27.87 v2(26.29,28.45)
  Bottom Layer w0.254: U5.2 24.93,32.37 ; v2(26.29,28.45) 24.93,29.81 U4.2
$1N1611: length 2.3
  Top Layer w0.254: U1.49 35.34,30.48 v2(35.56,30.48)
  Bottom Layer w0.254: 36.32,31.27 36.32,31.24 v2(35.56,30.48)
$1N1612: length 2.5
  Top Layer w0.254: v2(28.45,42.8) 28.45,42.76 27.2,41.51
  Bottom Layer w0.254: 28.97,43.19 28.84,43.19 v2(28.45,42.8)
$1N2522: length 3.8
  Bottom Layer w0.254: 27.94,52.32 P1.8
$1N2523: length 3.8
  Bottom Layer w0.254: 30.48,52.35 30.48,53.47 30.48,53.47 P1.10
$1N6488: length 1.5
  Top Layer w0.254: v2(29.97,16.89) 30.1,16.76 U32.24
  Bottom Layer w0.254: R29.1 29.97,16.83
$1N6489: length 1.5
  Top Layer w0.254: U32.23 30.6,16.76 v2(30.73,16.89)
  Bottom Layer w0.254: R30.1 31.07,17.23 v2(30.73,16.89)
$1N6494: length 3.1
  Top Layer w0.254: v2(33.24,12.06) 33.22,12.04 U32.12
  Bottom Layer w0.254: R31.2 34.65,12.3 34.42,12.06 v2(33.24,12.06)
$1N6499: length 2.3
  Top Layer w0.254: v2(30.86,10.67) 31.1,10.91 U32.9
  Bottom Layer w0.254: R32.2 30.13,10.67 v2(30.86,10.67)
$1N6502: length 2.6
  Top Layer w0.254: v2(32.51,11.05) 32.07,11.05 31.6,11.52 U32.10
  Bottom Layer w0.254: U33.1 32.88,11.05 v2(32.51,11.05)
$1N6503: length 3.3
  Top Layer w0.254: U32.20 32.1,16.48 32.77,17.14 v2(34.04,17.14)
  Bottom Layer w0.254: U34.2 34.52,17.14 v2(34.04,17.14)
$1N11456: length 2.7
  Bottom Layer w0.254: R44.2 42.04,34.55 U37.6
$1N14653: length 6.4
  Bottom Layer w0.254: D2.2 10.95,42.4 Q3.3 7.44,42.96 BUZZER1.2
$1N14654: length 3.3
  Bottom Layer w0.254: R8.2 11.55,40.4 Q3.1
$1N14984: length 0.6
  Top Layer w0.203: LED2.2 39.32,59.97 v2(39.32,59.7)
  Bottom Layer w0.203: v2(39.32,59.7) R47.1
$1N15262: length 0.8
  Top Layer w0.203: LED5.2 42.88,59.97 v2(42.88,59.63)
  Bottom Layer w0.203: v2(42.88,59.63) R50.1
$1N15508: length 0.9
  Top Layer w0.203: v2(7.75,59.58) 7.75,59.97 LED8.2
  Bottom Layer w0.203: v2(7.75,59.58) R53.1
$1N19842: length 0.9
  Top Layer w0.203: v2(11.94,59.56) LED9.2
  Bottom Layer w0.203: v2(11.94,59.56) 12,59.62 R54.1
$1N50866: length 2
  Bottom Layer w0.254: R12.1 42.42,51.93 U40.3

## Copper pours and planes (outline as drawn; the poured copper is in the pictures)
5V on Bottom Layer: 34.48,57.28 39.87,57.28 39.87,50.89 34.48,50.89
GND on Top Layer: 158.62,133.73 213.87,133.73 213.87,66.17 158.62,66.17
GND on Top Layer: -1.12,65.18 59.3,65.18 59.3,-7.24 -1.12,-7.24
GND on Bottom Layer: -2.38,66.15 53.42,66.15 53.42,-2.15 -2.38,-2.15
GND on Bottom Layer: -194.06,157.48 -130.94,157.48 -130.94,85.72 -194.06,85.72

Small or netless copper shapes (teardrops, artwork), in the pictures only: 285 on Top Layer, 217 on Bottom Layer

## Text on the board
Bottom Silkscreen Layer: FLASH | SPI-FLASH | 陀螺仪 | BUZZER | ENABLE
Top Silkscreen Layer: PC11 | PA15 | PD0 | PC13 | PB9 | PD6 | PD4 | PB5 | PE1 | PB3 | PB7 | PD2 | PA5 | PE3 | PA1 | PA3 | PE5 | PA7 | PC12 | PC10 | PD1 | PE2 | PD3 | PA0 | PA2 | PA4 | PD5 | PD7 | PB4 | PB6 | PB8 | PE0 | PE4 | PE6 | PA6 | PC4 | PD14 | PA12 | PA10 | PD12 | PD10 | PB14 | PB12 | PA8 | PC8 | PC6 | PD8 | PB10 | PE14 | PE12 | PE10 | GND | PE8 | PB1 | PC5 | 5V | PE13 | PA11 | PD15 | PD13 | PD11 | PB15 | PB13 | PE11 | PA9 | PC7 | PD9 | PB11 | PE15 | PE9 | PE7 | PB0 | 3V3 | LED1 | LED2 | MPU6050 | Cortex®-M4 | KEY1 | KEY2 | KEY3 | KEY4 | STM32F407
